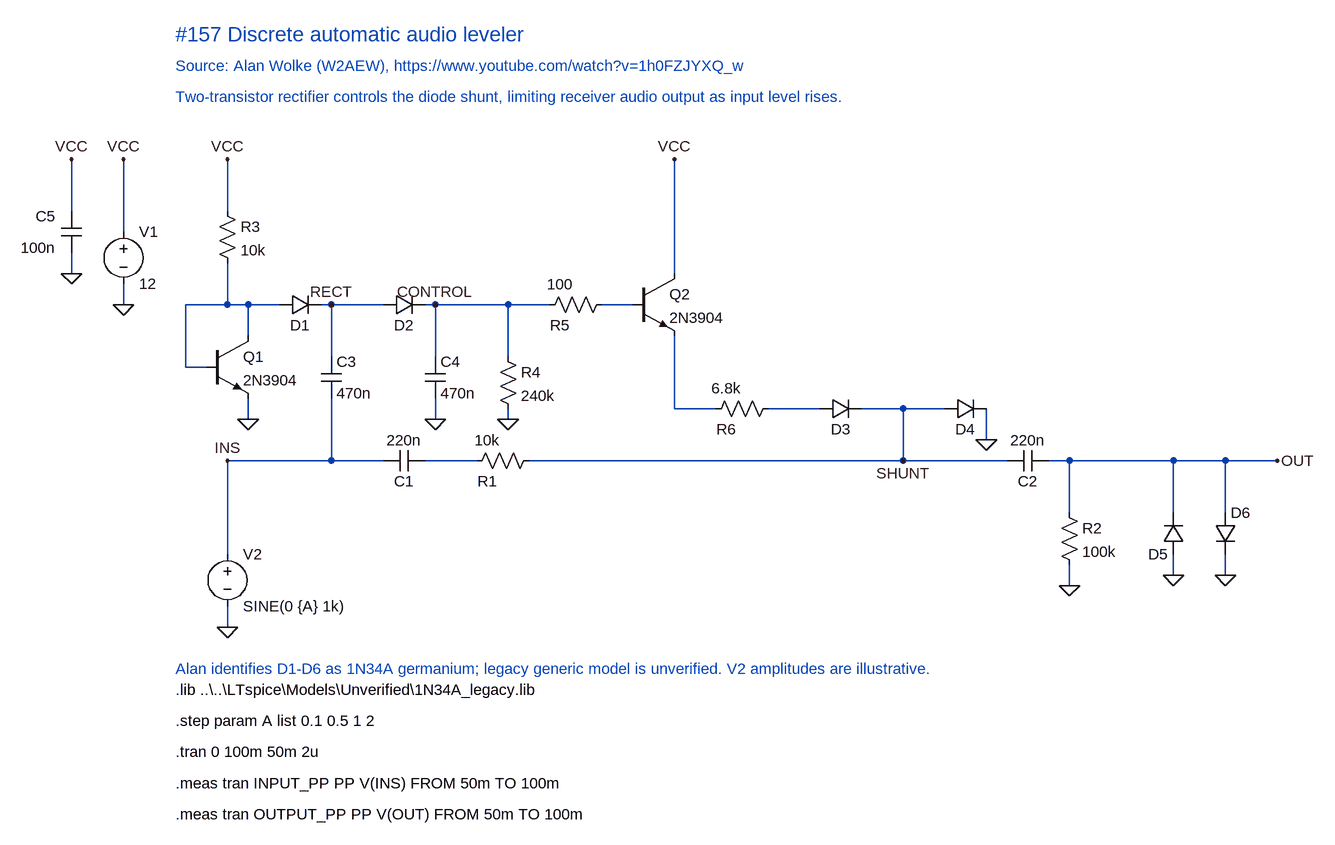
[diagram p0: schematic Discrete audio leveler.asc]
Discrete audio leveler.asc, the LTspice schematic file:
Version 4.1
SHEET 1 1900 1050
WIRE -80 -144 -80 -32
WIRE -160 -144 -160 -64
WIRE 80 -144 80 -64
WIRE 768 -144 768 32
WIRE -160 32 -160 0
WIRE -80 80 -80 48
WIRE 80 80 80 16
WIRE 112 80 80 80
WIRE 160 80 112 80
WIRE 16 80 80 80
WIRE 16 176 16 80
WIRE 48 176 16 176
WIRE 112 128 112 80
WIRE 112 256 112 224
WIRE 240 80 224 80
WIRE 320 80 240 80
WIRE 400 80 384 80
WIRE 512 80 400 80
WIRE 576 80 512 80
WIRE 704 80 656 80
WIRE 400 160 400 80
WIRE 400 256 400 224
WIRE 512 160 512 80
WIRE 512 256 512 240
WIRE 240 160 240 80
WIRE 240 320 240 224
WIRE 80 320 80 464
WIRE 240 320 80 320
WIRE 320 320 240 320
WIRE 464 320 384 320
WIRE 1120 320 544 320
WIRE 768 240 768 128
WIRE 832 240 768 240
WIRE 992 240 912 240
WIRE 1120 240 1056 240
WIRE 1120 320 1120 240
WIRE 1184 240 1120 240
WIRE 1248 288 1248 240
WIRE 1280 320 1120 320
WIRE 1376 320 1344 320
WIRE 1536 320 1376 320
WIRE 1616 320 1536 320
WIRE 1696 320 1616 320
WIRE 1376 400 1376 320
WIRE 1376 512 1376 480
WIRE 1536 400 1536 320
WIRE 1536 496 1536 464
WIRE 1616 400 1616 320
WIRE 1616 496 1616 464
WIRE 80 576 80 544
FLAG -80 -144 VCC
FLAG -160 -144 VCC
FLAG 80 -144 VCC
FLAG 768 -144 VCC
FLAG -160 32 0
FLAG -80 80 0
FLAG 112 256 0
FLAG 400 256 0
FLAG 512 256 0
FLAG 80 320 INS
FLAG 80 576 0
FLAG 1248 288 0
FLAG 1376 512 0
FLAG 1536 496 0
FLAG 1616 496 0
FLAG 1696 320 OUT
FLAG 240 80 RECT
FLAG 400 80 CONTROL
FLAG 1120 320 SHUNT
SYMBOL voltage -80 -48 R0
SYMATTR InstName V1
SYMATTR Value 12
SYMBOL cap -176 -64 R0
WINDOW 0 -8 8 Right 2
WINDOW 3 -8 56 Right 2
SYMATTR InstName C5
SYMATTR Value 100n
SYMBOL res 64 -80 R0
SYMATTR InstName R3
SYMATTR Value 10k
SYMBOL npn 48 128 R0
SYMATTR InstName Q1
SYMATTR Value 2N3904
SYMBOL diode 160 96 R270
WINDOW 0 0 32 VBottom 2
WINDOW 3 0 0 Invisible 2
SYMATTR InstName D1
SYMATTR Value 1N34A_LEGACY
SYMBOL diode 320 96 R270
WINDOW 0 0 32 VBottom 2
WINDOW 3 0 0 Invisible 2
SYMATTR InstName D2
SYMATTR Value 1N34A_LEGACY
SYMBOL cap 224 160 R0
SYMATTR InstName C3
SYMATTR Value 470n
SYMBOL cap 384 160 R0
SYMATTR InstName C4
SYMATTR Value 470n
SYMBOL res 496 144 R0
SYMATTR InstName R4
SYMATTR Value 240k
SYMBOL res 560 96 R270
WINDOW 0 0 32 VBottom 2
WINDOW 3 32 32 VTop 2
SYMATTR InstName R5
SYMATTR Value 100
SYMBOL npn 704 32 R0
SYMATTR InstName Q2
SYMATTR Value 2N3904
SYMBOL voltage 80 448 R0
SYMATTR InstName V2
SYMATTR Value SINE(0 {A} 1k)
SYMBOL cap 320 336 R270
WINDOW 0 0 32 VBottom 2
WINDOW 3 32 32 VTop 2
SYMATTR InstName C1
SYMATTR Value 220n
SYMBOL res 448 336 R270
WINDOW 0 0 32 VBottom 2
WINDOW 3 32 32 VTop 2
SYMATTR InstName R1
SYMATTR Value 10k
SYMBOL res 816 256 R270
WINDOW 0 0 32 VBottom 2
WINDOW 3 32 32 VTop 2
SYMATTR InstName R6
SYMATTR Value 6.8k
SYMBOL diode 992 256 R270
WINDOW 0 0 32 VBottom 2
WINDOW 3 0 0 Invisible 2
SYMATTR InstName D3
SYMATTR Value 1N34A_LEGACY
SYMBOL diode 1184 256 R270
WINDOW 0 0 32 VBottom 2
WINDOW 3 0 0 Invisible 2
SYMATTR InstName D4
SYMATTR Value 1N34A_LEGACY
SYMBOL cap 1280 336 R270
WINDOW 0 0 32 VBottom 2
WINDOW 3 32 32 VTop 2
SYMATTR InstName C2
SYMATTR Value 220n
SYMBOL res 1360 384 R0
SYMATTR InstName R2
SYMATTR Value 100k
SYMBOL diode 1552 464 R180
WINDOW 3 0 0 Invisible 2
SYMATTR InstName D5
SYMATTR Value 1N34A_LEGACY
SYMBOL diode 1600 400 R0
WINDOW 3 0 0 Invisible 2
SYMATTR InstName D6
SYMATTR Value 1N34A_LEGACY
TEXT 0 -336 Left 3 ;#157 Discrete automatic audio leveler
TEXT 0 -288 Left 2 ;Source: Alan Wolke (W2AEW), https://www.youtube.com/watch?v=1h0FZJYXQ_w
TEXT 0 -240 Left 2 ;Two-transistor rectifier controls the diode shunt, limiting receiver audio output as input level rises.
TEXT 0 640 Left 2 ;Alan identifies D1-D6 as 1N34A germanium; legacy generic model is unverified. V2 amplitudes are illustrative.
TEXT 0 672 Left 2 !.lib ..\..\LTspice\Models\Unverified\1N34A_legacy.lib
TEXT 0 720 Left 2 !.step param A list 0.1 0.5 1 2
TEXT 0 768 Left 2 !.tran 0 100m 50m 2u
TEXT 0 816 Left 2 !.meas tran INPUT_PP PP V(INS) FROM 50m TO 100m
TEXT 0 864 Left 2 !.meas tran OUTPUT_PP PP V(OUT) FROM 50m TO 100m

The netlist it stands for:
* Discrete audio leveler.asc
V1 VCC 0 12
C5 VCC 0 100n
R3 VCC N001 10k
Q1 N001 N001 0 0 2N3904
D1 N001 RECT 1N34A_LEGACY
D2 RECT CONTROL 1N34A_LEGACY
C3 RECT INS 470n
C4 CONTROL 0 470n
R4 CONTROL 0 240k
R5 CONTROL N002 100
Q2 VCC N002 N004 0 2N3904
V2 INS 0 SINE(0 {A} 1k)
C1 INS N003 220n
R1 N003 SHUNT 10k
R6 N004 N005 6.8k
D3 N005 SHUNT 1N34A_LEGACY
D4 SHUNT 0 1N34A_LEGACY
C2 SHUNT OUT 220n
R2 OUT 0 100k
D5 0 OUT 1N34A_LEGACY
D6 OUT 0 1N34A_LEGACY
.model D D
.lib standard.dio
.model NPN NPN
.model PNP PNP
.lib standard.bjt
* #157 Discrete automatic audio leveler
* Source: Alan Wolke (W2AEW), https://www.youtube.com/watch?v=1h0FZJYXQ_w
* Two-transistor rectifier controls the diode shunt, limiting receiver audio output as input level rises.
* Alan identifies D1-D6 as 1N34A germanium; legacy generic model is unverified. V2 amplitudes are illustrative.
.lib ..\..\LTspice\Models\Unverified\1N34A_legacy.lib
.step param A list 0.1 0.5 1 2
.tran 0 100m 50m 2u
.meas tran INPUT_PP PP V(INS) FROM 50m TO 100m
.meas tran OUTPUT_PP PP V(OUT) FROM 50m TO 100m
.backanno
.end